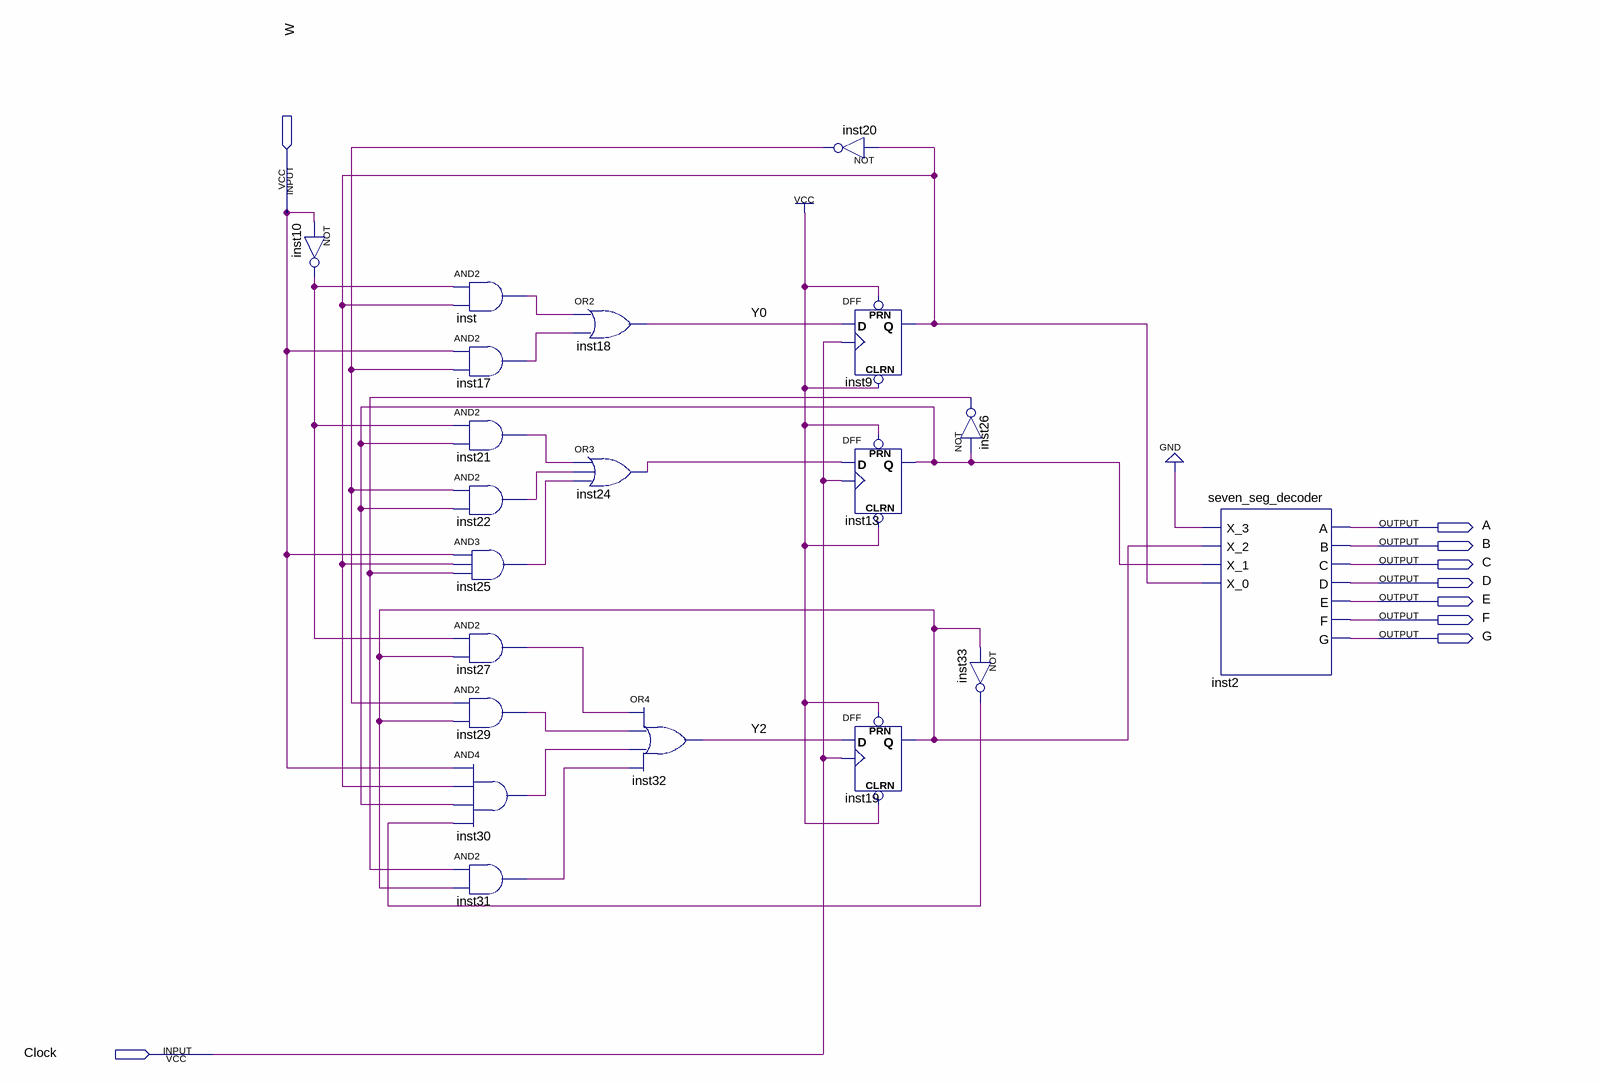
[diagram p0: schematic sheet]
// Quartus schematic counter_mod.bdf as structural Verilog: 20 symbols, 9 pins
module counter_mod (
  input  W,
  input  Clock,
  output A,
  output B,
  output C,
  output D,
  output E,
  output F,
  output G
);

  wire inst9_q, inst10_out, inst13_q, inst17_out, inst19_q, inst20_out, inst21_out, inst22_out, inst24_out,
       inst25_out, inst26_out, inst27_out, inst29_out, inst30_out, inst31_out, inst33_out, inst_out, Y0, Y2;

  not inst10 (inst10_out, W);
  and inst (inst_out, inst10_out, inst9_q);
  and inst17 (inst17_out, W, inst20_out);
  and inst21 (inst21_out, inst10_out, inst13_q);
  and inst22 (inst22_out, inst20_out, inst13_q);
  and inst25 (inst25_out, W, inst9_q, inst26_out);
  and inst27 (inst27_out, inst10_out, inst19_q);
  and inst29 (inst29_out, inst20_out, inst19_q);
  and inst30 (inst30_out, W, inst9_q, inst13_q, inst33_out);
  and inst31 (inst31_out, inst26_out, inst19_q);
  or inst18 (Y0, inst_out, inst17_out);
  or inst24 (inst24_out, inst21_out, inst22_out, inst25_out);
  or inst32 (Y2, inst27_out, inst29_out, inst30_out, inst31_out);
  not inst20 (inst20_out, inst9_q);
  DFF inst9 (.CLRN(1'b1), .CLK(Clock), .D(Y0), .PRN(1'b1), .Q(inst9_q));
  DFF inst13 (.CLRN(1'b1), .CLK(Clock), .D(inst24_out), .PRN(1'b1), .Q(inst13_q));
  DFF inst19 (.CLRN(1'b1), .CLK(Clock), .D(Y2), .PRN(1'b1), .Q(inst19_q));
  not inst26 (inst26_out, inst13_q);
  not inst33 (inst33_out, inst19_q);
  seven_seg_decoder inst2 (
    .X_3(1'b0), .X_2(inst19_q), .X_1(inst13_q), .X_0(inst9_q), .A(A), .B(B), .C(C), .D(D), .E(E), .F(F), .G(G));
endmodule
